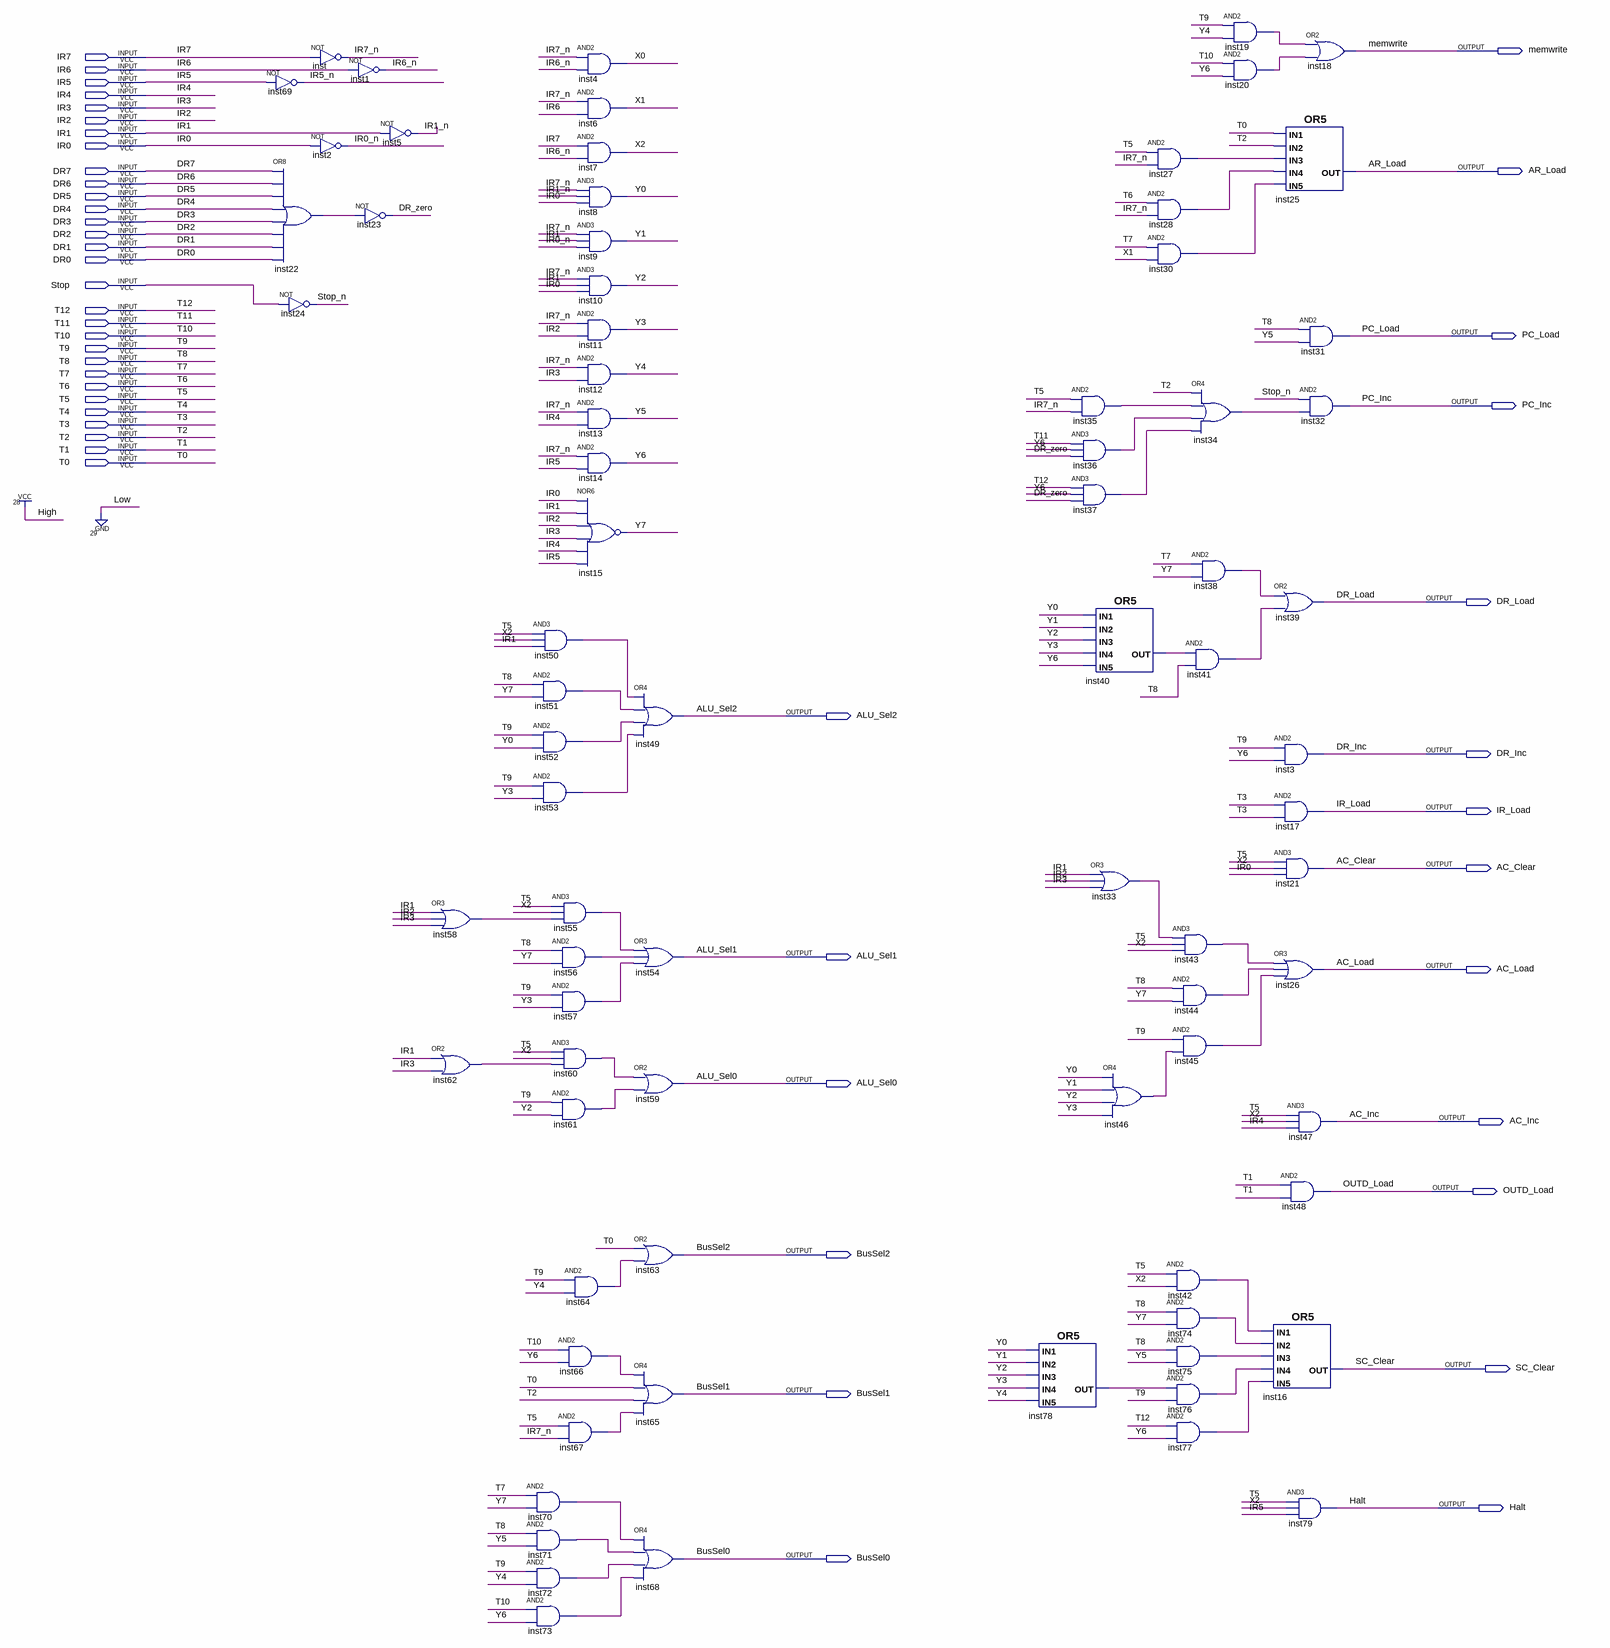
[diagram p0: schematic sheet]
// Quartus schematic lab4controller.bdf as structural Verilog: 79 symbols, 49 pins
module lab4controller (
  input  IR7,
  input  IR6,
  input  IR5,
  input  IR4,
  input  IR3,
  input  IR2,
  input  IR1,
  input  IR0,
  input  DR7,
  input  DR6,
  input  DR5,
  input  DR4,
  input  DR3,
  input  DR2,
  input  DR1,
  input  DR0,
  input  Stop,
  input  T12,
  input  T11,
  input  T10,
  input  T9,
  input  T8,
  input  T7,
  input  T6,
  input  T5,
  input  T4,
  input  T3,
  input  T2,
  input  T1,
  input  T0,
  output memwrite,
  output AR_Load,
  output PC_Load,
  output PC_Inc,
  output DR_Load,
  output ALU_Sel2,
  output DR_Inc,
  output IR_Load,
  output AC_Clear,
  output ALU_Sel1,
  output AC_Load,
  output ALU_Sel0,
  output AC_Inc,
  output OUTD_Load,
  output BusSel2,
  output SC_Clear,
  output BusSel1,
  output Halt,
  output BusSel0
);

  wire DR_zero, inst19_out, inst20_out, inst22_out, inst27_out, inst28_out, inst30_out, inst33_out,
       inst34_out, inst35_out, inst36_out, inst37_out, inst38_out, inst40_out, inst41_out, inst42_out,
       inst43_out, inst44_out, inst45_out, inst46_out, inst50_out, inst51_out, inst52_out, inst53_out,
       inst55_out, inst56_out, inst57_out, inst58_out, inst60_out, inst61_out, inst62_out, inst64_out,
       inst66_out, inst67_out, inst70_out, inst71_out, inst72_out, inst73_out, inst74_out, inst75_out,
       inst76_out, inst77_out, inst78_out, IR0_n, IR1_n, IR5_n, IR6_n, IR7_n, Stop_n, X0, X1, X2, Y0, Y1, Y2,
       Y3, Y4, Y5, Y6, Y7;

  not inst69 (IR5_n, IR5);
  or inst22 (inst22_out, DR7, DR6, DR5, DR4, DR3, DR2, DR1, DR0);
  not inst24 (Stop_n, Stop);
  not inst (IR7_n, IR7);
  not inst2 (IR0_n, IR0);
  not inst1 (IR6_n, IR6);
  not inst5 (IR1_n, IR1);
  not inst23 (DR_zero, inst22_out);
  or inst58 (inst58_out, IR1, IR2, IR3);
  or inst62 (inst62_out, IR1, IR3);
  and inst50 (inst50_out, T5, X2, IR1);
  and inst51 (inst51_out, T8, Y7);
  and inst52 (inst52_out, T9, Y0);
  and inst53 (inst53_out, T9, Y3);
  and inst70 (inst70_out, T7, Y7);
  and inst71 (inst71_out, T8, Y5);
  and inst72 (inst72_out, T9, Y4);
  and inst73 (inst73_out, T10, Y6);
  and inst4 (X0, IR7_n, IR6_n);
  and inst6 (X1, IR7_n, IR6);
  and inst7 (X2, IR7, IR6_n);
  and inst8 (Y0, IR7_n, IR1_n, IR0);
  and inst9 (Y1, IR7_n, IR1, IR0_n);
  and inst10 (Y2, IR7_n, IR1, IR0);
  and inst11 (Y3, IR7_n, IR2);
  and inst12 (Y4, IR7_n, IR3);
  and inst13 (Y5, IR7_n, IR4);
  and inst14 (Y6, IR7_n, IR5);
  nor inst15 (Y7, IR0, IR1, IR2, IR3, IR4, IR5);
  and inst55 (inst55_out, T5, X2, inst58_out);
  and inst56 (inst56_out, T8, Y7);
  and inst57 (inst57_out, T9, Y3);
  and inst60 (inst60_out, T5, X2, inst62_out);
  and inst61 (inst61_out, T9, Y2);
  and inst64 (inst64_out, T9, Y4);
  and inst66 (inst66_out, T10, Y6);
  and inst67 (inst67_out, T5, IR7_n);
  or inst49 (ALU_Sel2, inst50_out, inst51_out, inst52_out, inst53_out);
  or inst54 (ALU_Sel1, inst55_out, inst56_out, inst57_out);
  or inst59 (ALU_Sel0, inst60_out, inst61_out);
  or inst63 (BusSel2, T0, inst64_out);
  or inst65 (BusSel1, inst66_out, T0, T2, inst67_out);
  or inst68 (BusSel0, inst70_out, inst71_out, inst72_out, inst73_out);
  or inst78 (inst78_out, Y0, Y1, Y2, Y3, Y4);
  and inst35 (inst35_out, T5, IR7_n);
  and inst36 (inst36_out, T11, Y6, DR_zero);
  and inst37 (inst37_out, T12, Y6, DR_zero);
  or inst40 (inst40_out, Y0, Y1, Y2, Y3, Y6);
  or inst33 (inst33_out, IR1, IR2, IR3);
  and inst27 (inst27_out, T5, IR7_n);
  and inst28 (inst28_out, T6, IR7_n);
  and inst30 (inst30_out, T7, X1);
  or inst46 (inst46_out, Y0, Y1, Y2, Y3);
  or inst34 (inst34_out, T2, inst35_out, inst36_out, inst37_out);
  and inst38 (inst38_out, T7, Y7);
  and inst41 (inst41_out, inst40_out, T8);
  and inst43 (inst43_out, inst33_out, T5, X2);
  and inst44 (inst44_out, T8, Y7);
  and inst45 (inst45_out, T9, inst46_out);
  and inst42 (inst42_out, T5, X2);
  and inst74 (inst74_out, T8, Y7);
  and inst75 (inst75_out, T8, Y5);
  and inst76 (inst76_out, inst78_out, T9);
  and inst77 (inst77_out, T12, Y6);
  and inst19 (inst19_out, T9, Y4);
  and inst20 (inst20_out, T10, Y6);
  or inst25 (AR_Load, T0, T2, inst27_out, inst28_out, inst30_out);
  and inst31 (PC_Load, T8, Y5);
  and inst32 (PC_Inc, Stop_n, inst34_out);
  or inst39 (DR_Load, inst38_out, inst41_out);
  and inst3 (DR_Inc, T9, Y6);
  and inst17 (IR_Load, T3, T3);
  and inst21 (AC_Clear, T5, X2, IR0);
  or inst26 (AC_Load, inst43_out, inst44_out, inst45_out);
  and inst47 (AC_Inc, T5, X2, IR4);
  and inst48 (OUTD_Load, T1, T1);
  or inst16 (SC_Clear, inst42_out, inst74_out, inst75_out, inst76_out, inst77_out);
  and inst79 (Halt, T5, X2, IR5);
  or inst18 (memwrite, inst19_out, inst20_out);
endmodule
